# Altium schematic sheet Sensors-Sheet-1.SchDoc (part 3 of 3)
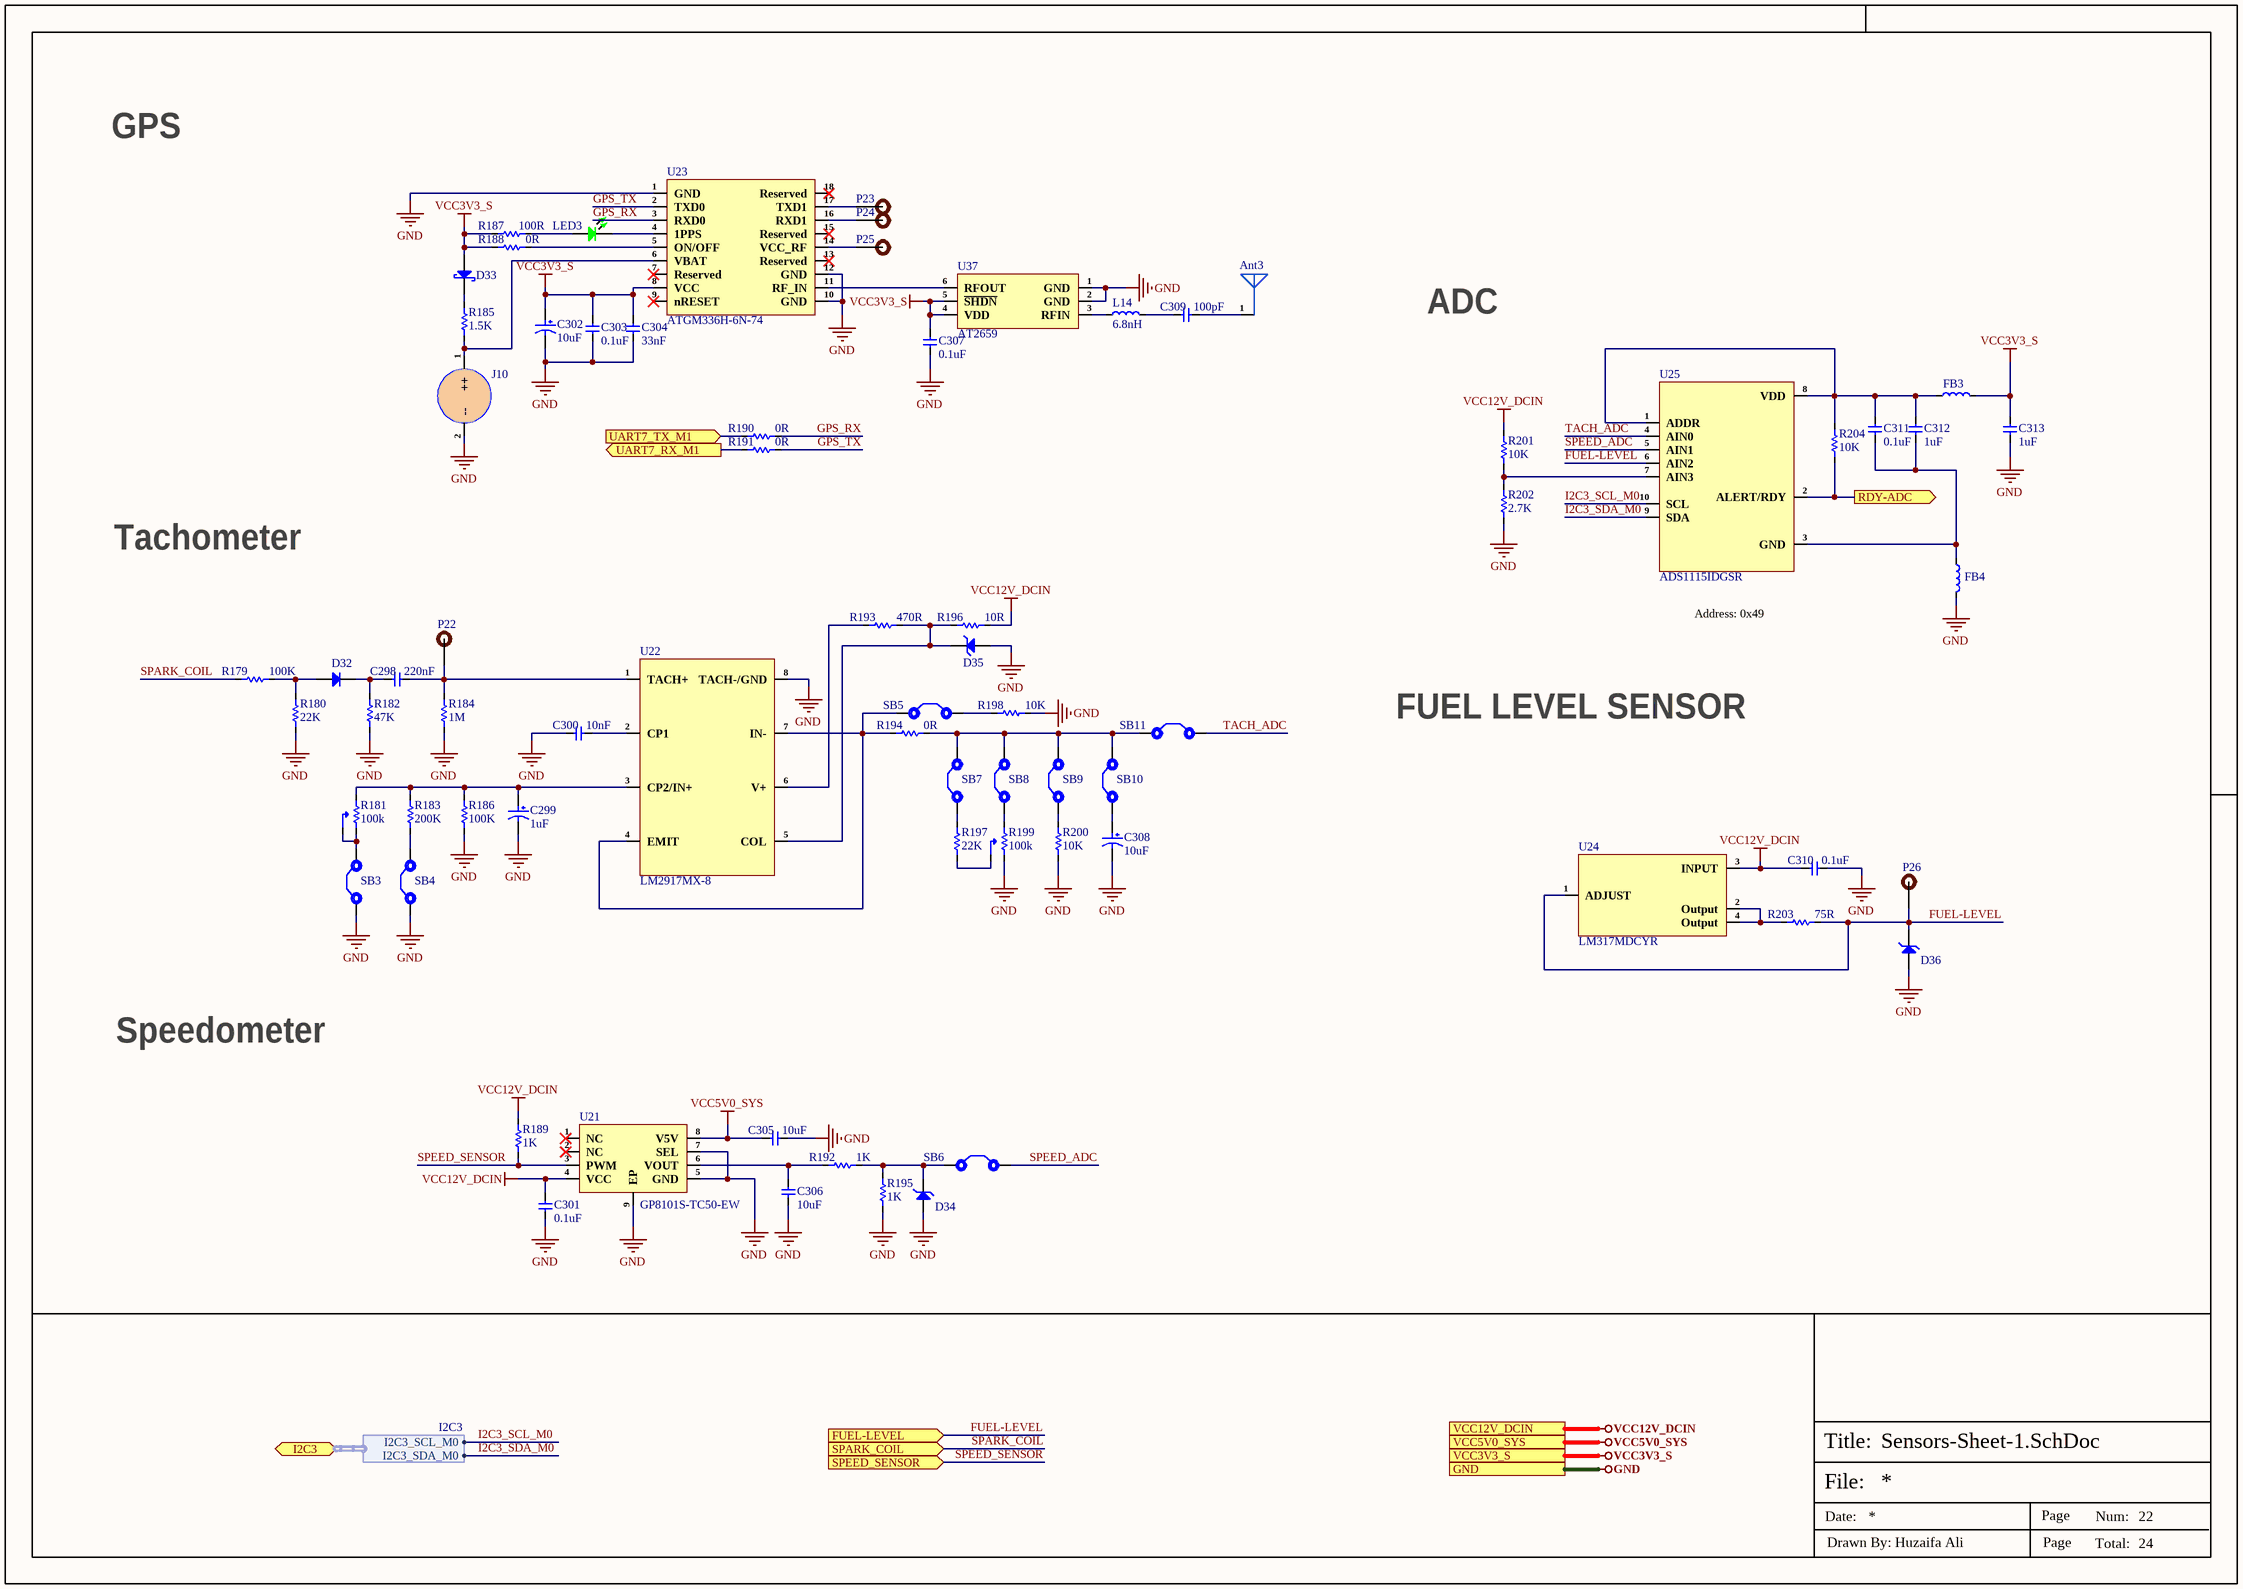
[diagram p2: Sensors-Sheet-1.SchDoc]

## Library data of the parts (continued)
R196 = RC0603FR-0710RL: RES SMD 10 OHM 1% 1/10W 0603; Manufacturer: Yageo; Temperature Coefficient: 200ppm/°C; Power Rating: 100mW; Voltage Rating: 50V; Item type: Resistor; Supplier 1: Digi-Key; Manufacturer Part Number: RC0603FR-0710RL; Stock 1: 10836596; Pricing 1: 1=0.1, 10=0.046, 100=0.0187, 1000=0.0084, 2500=0.00729 (USD); Case/Package: 0603; Number of Pins: 2; Case Code (Imperial): 0603; Case Code (Metric): 1608; Contact Plating: Tin,Matte; Min Operating Temperature: -55°C; Max Operating Temperature: 155°C; Resistance: 10R; Tolerance: 1%; Composition: Thick Film; Packaging: Tape and Reel; Voltage Rating (DC): 50V; Termination: SMD/SMT; Military Standard: Not; Length: 1.6mm; Height: 0.45mm; Width: 0.8mm; Depth: 0.8mm; Radiation Hardening: No; Lead Free: Lead Free; REACH SVHC: No SVHC; ComponentLink1URL: http://www.farnell.com/datasheets/1868787.pdf?src-supplier=Element14; ComponentLink1Description: http://www.farnell.com/datasheets/1868787.pdf?src-supplier=Element14; ComponentLink2URL: http://www.yageo.com/documents/recent/PYu-RC0603_51_RoHS_L_4.pdf?src-supplier=Avnet; ComponentLink2Description: http://www.yageo.com/documents/recent/PYu-RC0603_51_RoHS_L_4.pdf?src-supplier=Avnet; ComponentLink3URL: http://documents.rs-components.com/techlib://itc_doclist_GB.htm?stockno=5048984&src-supplier=RSComponents; ComponentLink3Description: http://documents.rs-components.com/techlib://itc_doclist_GB.htm?stockno=5048984&src-supplier=RSComponents; ComponentLink4URL: http://www.yageo.com/documents/recent/PYu-RC0603_51_RoHS_L_4.pdf?src-supplier=Avnet+Europe; ComponentLink4Description: http://www.yageo.com/documents/recent/PYu-RC0603_51_RoHS_L_4.pdf?src-supplier=Avnet+Europe; Supplier Part Number 1: 311-10.0HRDKR-ND; LCSC Part Number: C109318
R198 R200 R204 = RC0402FR-0710KL: RES 10K OHM 1% 1/16W 0402; Manufacturer: Yageo; Resistance: 10kR; Voltage Rating (DC): 50V; Temperature Coefficient: 100ppm/°C; Power Rating: 62.5mW; Max Power Dissipation: 63mW; Item Type: Resistor; Supplier 1: Mouser; Manufacturer Part Number: RC0402FR-0710KL; RoHS: Yes; Category: Chip SMD Resistors; Stock 1: 18648329; Pricing 1: 1=0.10000, 10=0.01400, 50=0.01400, 100=0.00500, 1000=0.00300, 10000=0.00200 (USD); Case/Package: 0402; Number of Pins: 2; Case Code (Imperial): 0402; Case Code (Metric): 1005; Min Operating Temperature: -55°C; Max Operating Temperature: 155°C; Resistor Type: Thick Film; Tolerance: 1%; Packaging: Tape and Reel; Voltage Rating: 50V; Termination: SMD/SMT; Working Voltage: 50V; Number of Terminations: 2; Features: Moisture Resistant; Series: RC; Resistance Tolerance: 1%; Construction: Rectangular; Length: 1mm; Width: 0.5mm; Height: 0.32mm; Depth: 0.5mm; Lead Pitch: 0.2mm; REACH SVHC: No SVHC; Lead Free: Lead Free; RoHS Compliant: Yes; Military Standard: Not; ComponentLink1URL: https://datasheet.ciiva.com/7660/38568-7660787.pdf?src-supplier=Element14; ComponentLink1Description: https://datasheet.ciiva.com/7660/38568-7660787.pdf?src-supplier=Element14; ComponentLink2URL: https://datasheet.ciiva.com/7849/1686128-7849814.pdf?src-supplier=Element14; ComponentLink2Description: https://datasheet.ciiva.com/7849/1686128-7849814.pdf?src-supplier=Element14; ComponentLink3URL: https://datasheet.ciiva.com/7983/1018594-7983486.pdf?src-supplier=Element14; ComponentLink3Description: https://datasheet.ciiva.com/7983/1018594-7983486.pdf?src-supplier=Element14; ComponentLink4URL: https://datasheet.ciiva.com/22747/1018594-22747512.pdf?src-supplier=Element14; ComponentLink4Description: https://datasheet.ciiva.com/22747/1018594-22747512.pdf?src-supplier=Element14; ComponentLink5URL: https://datasheet.ciiva.com/12667/pyu-rc0402-51-rohs-l-6-r-12667067.pdf?src-supplier=Mouser; ComponentLink5Description: https://datasheet.ciiva.com/12667/pyu-rc0402-51-rohs-l-6-r-12667067.pdf?src-supplier=Mouser; ComponentLink6URL: https://datasheet.ciiva.com/7849/1784430-7849813.pdf?src-supplier=Element14; ComponentLink6Description: https://datasheet.ciiva.com/7849/1784430-7849813.pdf?src-supplier=Element14; ComponentLink7URL: https://datasheet.ciiva.com/7849/1784430-7849815.pdf?src-supplier=Element14; ComponentLink7Description: https://datasheet.ciiva.com/7849/1784430-7849815.pdf?src-supplier=Element14; Supplier Part Number 1: 603-RC0402FR-0710KL; LCSC Part Number: C60490
R201 = RT0603BRD0710KL: RES SMD 10K OHM 0.1% 1/10W 0603; Manufacturer: Yageo; Power: 100mW; Rated Temperature: 70°C; Value: 10kR; Temperature Coefficient: 25ppm/°C; Working Voltage: 75V; Package Height: 0.45mm; Package Length: 1.6mm; Package Width: 0.8mm; Item Type: Resistor; Supplier 1: Rs; Manufacturer Part Number: RT0603BRD0710KL; RoHS: Yes; Category: Chip SMD Resistors; Stock 1: 20510; Pricing 1: 100=0.29800, 250=0.27800, 500=0.25900, 1000=0.23700 (GBP); Mounting Technology: Surface Mount; Pins: 2; Case/Package: 0603; Min Operating Temperature: -55°C; Max Operating Temperature: 155°C; Tolerance: 0.1%; Resistor Type: FIXED RESISTOR; Construction: Chip; Package Style: SMTMeter; Packaging: Tape and Reel; Technology: THIN FILM; Termination: Wraparound; Reach SVHC Compliant: Yes; RoHS Compliant: Yes; ComponentLink1URL: https://datasheet.ciiva.com:443/pdfs/VipMasterIC/IC/YAGO/YAGO-S-A0008510989/YAGO-S-A0008510989-1.pdf?src-supplier=IHS+Markit; ComponentLink1Description: https://datasheet.ciiva.com:443/pdfs/VipMasterIC/IC/YAGO/YAGO-S-A0008510989/YAGO-S-A0008510989-1.pdf?src-supplier=IHS+Markit; ComponentLink2URL: https://datasheet.ciiva.com/5624/pyu-rt-1-to-0-05-rohs-l-4-5624351.pdf?src-supplier=Mouser; ComponentLink2Description: https://datasheet.ciiva.com/5624/pyu-rt-1-to-0-05-rohs-l-4-5624351.pdf?src-supplier=Mouser; ComponentLink3URL: https://datasheet.ciiva.com/29721/pyu-rt-1-to-0-05-rohs-l-4-29721177.pdf?src-supplier=Digi-Key; ComponentLink3Description: https://datasheet.ciiva.com/29721/pyu-rt-1-to-0-05-rohs-l-4-29721177.pdf?src-supplier=Digi-Key; Supplier Part Number 1: 1991391P; LCSC Part Number: C95204
R202 = RT0603BRD072K7L: RES SMD 2.7K OHM 0.1% 1/10W 0603; Manufacturer: Yageo; Manufacturer Part Number: RT0603BRD07-2K7L; Temperature Coefficient: 25ppm/°C; Voltage Rating: 75V; Power Rating: 100mW; Voltage Rating (DC): 50V; Item Type: Resistor; Resistance: 2.7kR; RoHS: Yes; Category: Chip SMD Resistors; Mount: Surface Mount; Case/Package: 0603; Contact Plating: Tin,Matte; Case Code (Metric): 1608; Case Code (Imperial): 0603; Size Code: 0603; Min Operating Temperature: -55°C; Max Operating Temperature: 125°C; Resistor Type: Thin Film; Packaging: Tape and Reel; Package Quantity: 5000; Termination: SMD/SMT; Number of Terminations: 2; Max Power Dissipation: 100mW; Features: Moisture Resistant; Series: RT; Construction: Rectangular; Length: 0.063inch; Width: 0.031inch; Height: 0.022inch; Depth: 0.8mm; Radiation Hardening: No; Military Standard: Not; Lead Free: Lead Free; RoHS Compliant: Yes; ComponentLink1URL: https://datasheet.ciiva.com/8894/pyu-rt-1-to-0-05-rohs-l-4-8894140.pdf?src-supplier=Avnet; ComponentLink1Description: https://datasheet.ciiva.com/8894/pyu-rt-1-to-0-05-rohs-l-4-8894140.pdf?src-supplier=Avnet; ComponentLink2URL: https://datasheet.ciiva.com/2585/pyu-rt-1-to-0-05-rohs-l-4-2585861.pdf?src-supplier=Digi-Key; ComponentLink2Description: https://datasheet.ciiva.com/2585/pyu-rt-1-to-0-05-rohs-l-4-2585861.pdf?src-supplier=Digi-Key; ComponentLink3URL: https://datasheet.ciiva.com/46635/pyu-rt-1-to-0-05-rohs-l-5-46635318.pdf?src-supplier=Digi-Key; ComponentLink3Description: https://datasheet.ciiva.com/46635/pyu-rt-1-to-0-05-rohs-l-5-46635318.pdf?src-supplier=Digi-Key; Supplier Part Number 1: RT0603BRD072K7L; LCSC Part Number: C705760; Supplier 1: Avnet
R203 = RC0603FR-0775RL: RES 75 OHM 1% 1/10W 0603; Manufacturer: Yageo; Temperature Coefficient: 100ppm/°C; Voltage Rating (DC): 50V; Power Rating: 100mW; Item Type: Resistor; Supplier: Digikey; Supplier Part Number: 311-75.0HRCT-ND; Manufacturer Part Number: RC0603FR-0775RL; RoHS: Yes; Category: Chip SMD Resistors; Stock: 844005; Pricing: 1=0.1, 10=0.019, 50=0.0112, 100=0.0093, 500=0.00622, 1000=0.00532 (USD); Case/Package: 0603; Case Code (Metric): 1608; Case Code (Imperial): 0603; Min Operating Temperature: -55°C; Max Operating Temperature: 155°C; Value: 75R; Tolerance: 1%; Resistor Type: Thick Film; Packaging: Tape and Reel; Voltage Rating: 50V; Package Quantity: 1; Number of Terminations: 2; Termination: SMD/SMT; Max Power Dissipation: 100mW; Features: Moisture Resistant; Series: RC; Resistance Tolerance: 1%; Construction: Rectangular; Technology: THICK FILM; Length: 0.063inch; Width: 0.031inch; Height: 0.022inch; Depth: 0.8mm; Lead Free: 5697LeadFree; Reach SVHC Compliant: No; Military Standard: Not; RoHS Compliant: Yes; LCSC Part Number: C112309
SB3-SB11 = Solder Bridge 0603: Solder Bridge ON; Manufacturer Part Number: Solder Bridge; Item Type: Solder Bridge
U21 = GP8101S-TC50-EW: ESOP-8 ADC/DAC - Specialized ROHS; Manufacturer: Guestgood; Item Type: IC; Manufacturer Part Number: GP8101S-TC50-EW; Package: ESOP-8; LCSC Part Number: C2837711; ComponentLink1Description: LCSC; ComponentLink1URL: https://www.lcsc.com/product-detail/ADC-DAC-Specialized_Guestgood-GP8101S-TC50-EW_C2837711.html
U22 = LM2917MX-8: IC F/V CONV 10KHZ 8SOIC; Manufacturer: TI National Semiconductor; Supplier: Digikey; Supplier Part Number: 296-36310-2-ND; Manufacturer Part Number: LM2917MX-8; RoHS: No; Item Type: IC; Pricing: 2500=1.20124, 5000=1.15675 (USD); Lead Free: 5698LeadFree; ComponentLink1URL: https://datasheet.ciiva.com/15145/getdatasheetpartid-629387-15145650.pdf?src-supplier=Verical; ComponentLink1Description: https://datasheet.ciiva.com/15145/getdatasheetpartid-629387-15145650.pdf?src-supplier=Verical; ComponentLink2URL: https://datasheet.ciiva.com/18553/lm2917-n-18553573.pdf?src-supplier=Digikey; ComponentLink2Description: https://datasheet.ciiva.com/18553/lm2917-n-18553573.pdf?src-supplier=Digikey; ComponentLink3URL: https://datasheet.ciiva.com/18553/lm2917-n-18553575.pdf?src-supplier=Digikey; ComponentLink3Description: https://datasheet.ciiva.com/18553/lm2917-n-18553575.pdf?src-supplier=Digikey
U23 = ATGM336H-6N-74: SMD,10.1x9.7mm Satellite Positioning Modules ROHS; Manufacturer: ZHONGKEWEI; Manufacturer Part Number: ATGM336H-6N-74; Package: SMD,10.1x9.7mm; LCSC Part Number: C5804601; ComponentLink1Description: LCSC; ComponentLink1URL: https://www.lcsc.com/product-detail/Satellite-Positioning-Modules_ZHONGKEWEI-ATGM336H-6N-74_C5804601.html
U24 = LM317MDCYR: IC REG LIN POS ADJ 500MA SOT223; Manufacturer: Texas Instruments; Output Voltage: 37V; Number of Outputs: 1; Min Input Voltage: 4.2V; Max Supply Voltage: 40V; Polarity: Positive; Min Output Voltage: 1.25V; Quiescent Current: 3.5mA; Output Type: Adjustable; Reference Voltage: 1.3V; Power Supply Rejection Ratio (PSRR): 80dB; Supplier: Mouser; Supplier Part Number: 595-LM317MDCYR; Manufacturer Part Number: LM317MDCYR; RoHS: Yes; Category: Voltage Regulators - Linear; Stock: 12890; Pricing: 1=0.67, 10=0.564, 50=0.564, 100=0.428, 500=0.359, 1000=0.283, 2500=0.263, 5000=0.245, 10000=0.236, 25000=0.227 (USD); Mounting Technology: Surface Mount; Case/Package: SOT-223-4; Pins: 4; Weight: 0.006632oz; Min Operating Temperature: -40°C; Max Operating Temperature: 125°C; Packaging: Tape and Reel; Output Current: 500mA; Number of Regulators: 1; Max Output Voltage: 37V; Package Quantity: 1; Max Output current: 500mA; Series: -; Radiation Hardening: No; Reach SVHC Compliant: No; Lead Free: Lead Free; RoHS Compliant: Yes; ComponentLink1URL: https://datasheet.ciiva.com/1643/755612-1643356.pdf?src-supplier=Newark; ComponentLink1Description: https://datasheet.ciiva.com/1643/755612-1643356.pdf?src-supplier=Newark; ComponentLink2URL: https://datasheet.ciiva.com/41458/001014040-da-01-en-ic-reg-adj-0-5-lm317mdcyr-sot-223-4-tid-41458215.pdf?src-supplier=Conrad; ComponentLink2Description: https://datasheet.ciiva.com/41458/001014040-da-01-en-ic-reg-adj-0-5-lm317mdcyr-sot-223-4-tid-41458215.pdf?src-supplier=Conrad; ComponentLink3URL: https://datasheet.ciiva.com/1512/1814942-1512040.pdf?src-supplier=Element14; ComponentLink3Description: https://datasheet.ciiva.com/1512/1814942-1512040.pdf?src-supplier=Element14; ComponentLink4URL: https://datasheet.ciiva.com/46398/755612-46398903.pdf?src-supplier=Element14; ComponentLink4Description: https://datasheet.ciiva.com/46398/755612-46398903.pdf?src-supplier=Element14; ComponentLink5URL: https://datasheet.ciiva.com/46419/1814942-46419370.pdf?src-supplier=Element14; ComponentLink5Description: https://datasheet.ciiva.com/46419/1814942-46419370.pdf?src-supplier=Element14; ComponentLink6URL: https://datasheet.ciiva.com/2042/lm317m-2042100.pdf?src-supplier=Digikey; ComponentLink6Description: https://datasheet.ciiva.com/2042/lm317m-2042100.pdf?src-supplier=Digikey; ComponentLink7URL: https://datasheet.ciiva.com/2042/lm317m-2042099.pdf?src-supplier=Digikey; ComponentLink7Description: https://datasheet.ciiva.com/2042/lm317m-2042099.pdf?src-supplier=Digikey; ComponentLink8URL: https://datasheet.ciiva.com/2042/lm317m-2042101.pdf?src-supplier=Digikey; ComponentLink8Description: https://datasheet.ciiva.com/2042/lm317m-2042101.pdf?src-supplier=Digikey; ComponentLink9URL: https://datasheet.ciiva.com/14280/lm317mq-14280776.pdf?src-supplier=Avnet; ComponentLink9Description: https://datasheet.ciiva.com/14280/lm317mq-14280776.pdf?src-supplier=Avnet; LCSC Part Number: C840113; Item Type: IC
U25 = ADS1115IDGSR: IC ADC 16BIT SIGMA-DELTA 10VSSOP; Manufacturer: Texas Instruments; Interface: I2C; Number of Bits: 16; Sampling Rate: 860S/s; Number of A/D Converters: 1; Resolution: 16b; Polarity: Bipolar; Min Supply Voltage: 2V; Max Supply Voltage: 5.5V; Supply Type: Single; Conversion Rate: 0.86KS/s; Number of Inputs: 4; Integral Nonlinearity (INL): 1LSB; Power Dissipation: 900uW; Nominal Supply Current: 150uA; Number of Channels: 2; Supplier: Mouser; Supplier Part Number: 595-ADS1115IDGSR; Manufacturer Part Number: ADS1115IDGSR; RoHS: Yes; Category: Analog to Digital Converters (ADCs); Stock: 5925; Pricing: 1=5.44, 10=4.76, 50=4.76, 100=4.01, 1000=2.88, 10000=2.78 (USD); Case/Package: VSSOP; Pins: 10; Contact Plating: Gold; Min Operating Temperature: -40°C; Max Operating Temperature: 125°C; Package Quantity: 2500; Packaging: Tape and Reel; Number of Converters: 1; Max Supply Voltage (DC): 5.5V; Min Supply Voltage (DC): 2V; Series: -; Length: 3mm; Width: 3mm; Height: 1.07mm; Thickness: 1.02mm; Reach SVHC Compliant: No; Lead Free: Lead Free; RoHS Compliant: Yes; ComponentLink1URL: https://datasheet.ciiva.com/4031/47725463s8438921n7713-4031028.pdf?src-supplier=Arrow+Electronics; ComponentLink1Description: https://datasheet.ciiva.com/4031/47725463s8438921n7713-4031028.pdf?src-supplier=Arrow+Electronics; LCSC Part Number: C37593; Item Type: IC
U37 = AT2659: 1.4V~3.6V 4.3mA DFN-6(1x1.6) Low Noise Amplifiers (LNA) - RF ROHS; Manufacturer: ZHONGKEWEI; Manufacturer Part Number: AT2659; Package: DFN-6(1x1.6); LCSC Part Number: C92450; Item Type: LNA; ComponentLink1Description: LCSC; ComponentLink1URL: https://www.lcsc.com/product-detail/Low-Noise-Amplifiers-LNA-RF_ZHONGKEWEI-AT2659_C92450.html